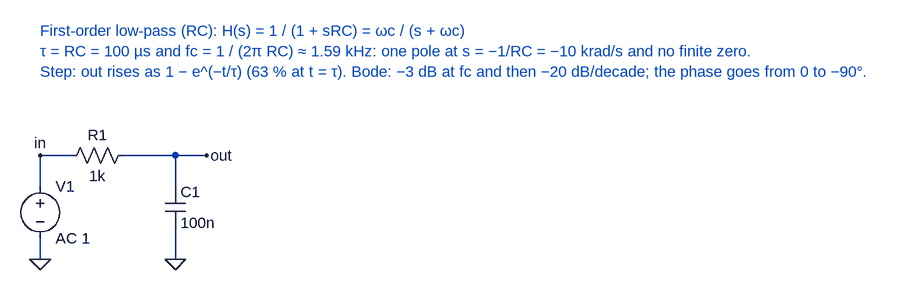
[diagram p0: schematic lp1.asc]
lp1.asc, the LTspice schematic file:
Version 4
SHEET 1 1200 800
WIRE 0 -32 48 -32
WIRE 128 -32 208 -32
WIRE 208 -32 256 -32
WIRE 208 -32 208 16
WIRE 208 80 208 128
WIRE 0 16 0 -32
WIRE 0 96 0 128
FLAG 208 128 0
FLAG 256 -32 out
FLAG 0 128 0
FLAG 0 -32 in
SYMBOL voltage 0 0 R0
SYMATTR InstName V1
SYMATTR Value AC 1
SYMBOL res 144 -48 R90
WINDOW 0 0 56 VBottom 2
WINDOW 3 32 56 VTop 2
SYMATTR InstName R1
SYMATTR Value 1k
SYMBOL cap 192 16 R0
SYMATTR InstName C1
SYMATTR Value 100n
TEXT 0 -224 Left 2 ;First-order low-pass (RC): H(s) = 1 / (1 + sRC) = ωc / (s + ωc)\nτ = RC = 100 µs and fc = 1 / (2π RC) ≈ 1.59 kHz: one pole at s = −1/RC = −10 krad/s and no finite zero.\nStep: out rises as 1 − e^(−t/τ) (63 % at t = τ). Bode: −3 dB at fc and then −20 dB/decade; the phase goes from 0 to −90°.

The netlist it stands for:
* lp1.asc
V1 in 0 AC 1
R1 out in 1k
C1 out 0 100n
* First-order low-pass (RC): H(s) = 1 / (1 + sRC) = ωc / (s + ωc)
* τ = RC = 100 µs and fc = 1 / (2π RC) ≈ 1.59 kHz: one pole at s = −1/RC = −10 krad/s and no finite zero.
* Step: out rises as 1 − e^(−t/τ) (63 % at t = τ). Bode: −3 dB at fc and then −20 dB/decade; the phase goes from 0 to −90°.
.backanno
.end